# Altium project Main_Board.PrjPcb (part 25 of 44)

## Sheet RAM_Power.SchDoc: RAM_POWER
size A3; Organization: Altium Limited; Address1: L3, 12a Rodborough Rd; Address2: Frenchs Forest; Address3: NSW; Address4: Australia 2086
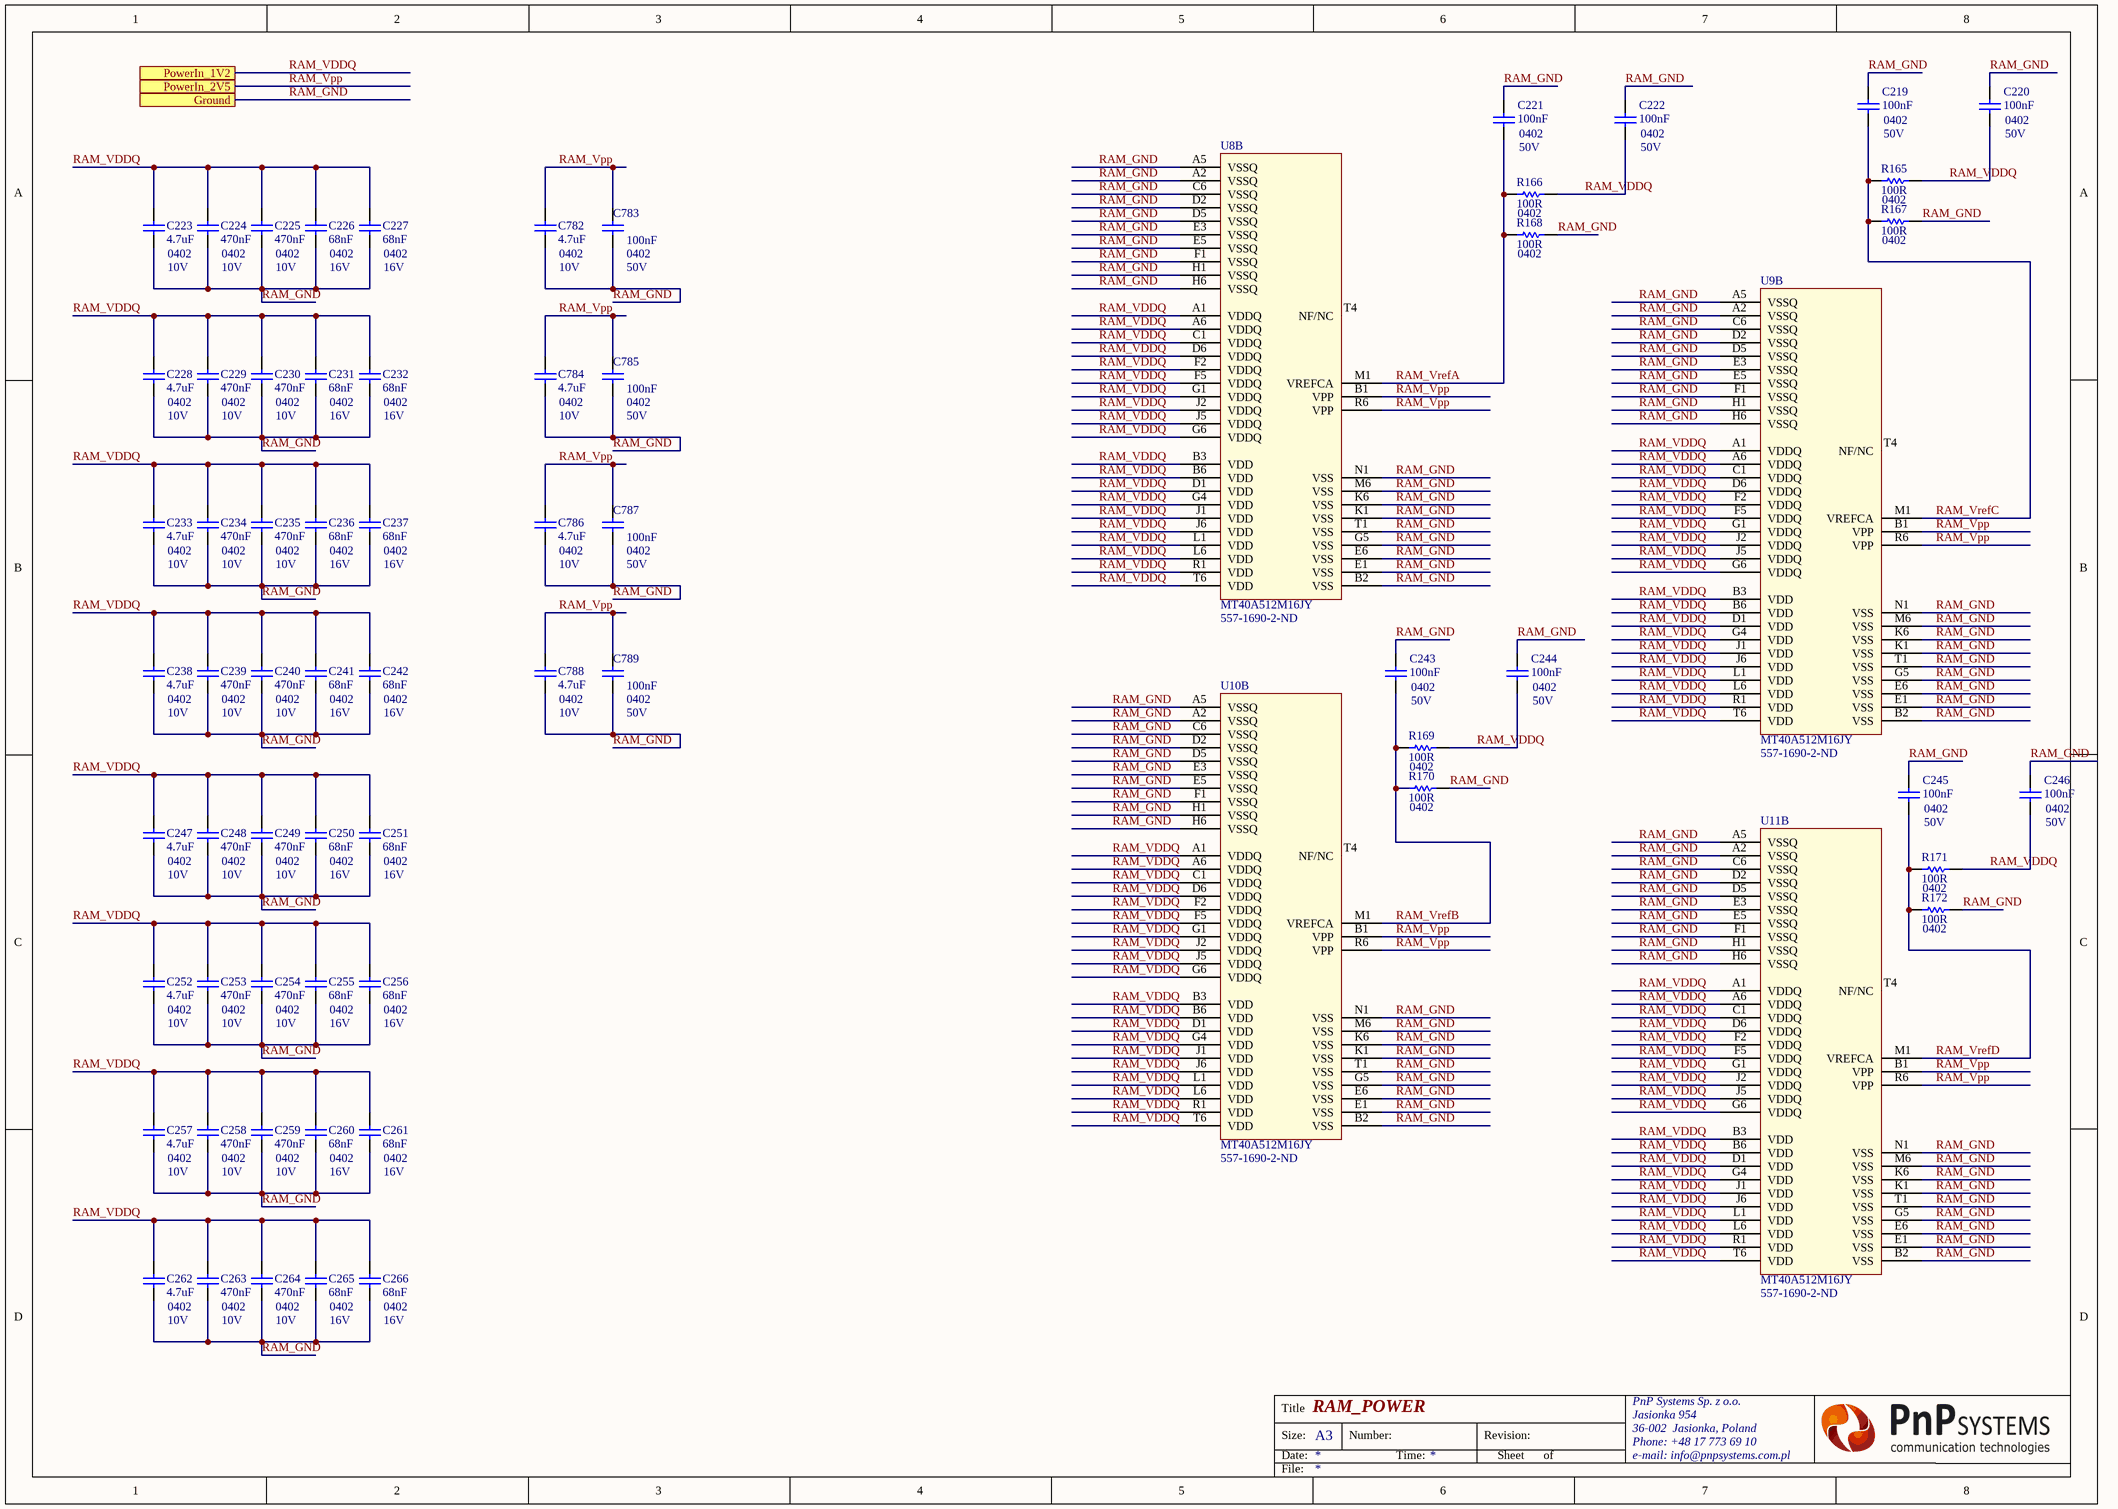
[diagram p34: RAM_Power.SchDoc]

### Parts
C219  100nF  Case Code (Imperial): 0402  Voltage: 50V  [CAP 0402/1005 KK]
C220  100nF  Case Code (Imperial): 0402  Voltage: 50V  [CAP 0402/1005 KK]
C221  100nF  Case Code (Imperial): 0402  Voltage: 50V  [CAP 0402/1005 KK]
C222  100nF  Case Code (Imperial): 0402  Voltage: 50V  [CAP 0402/1005 KK]
C223  4.7uF  Case/Package: 0402  Voltage Rating: 10V  [CAP 0402/1005 KK]
C224  470nF  Case/Package: 0402  Voltage Rating: 10V  [CAP 0402/1005 KK]
C225  470nF  Case/Package: 0402  Voltage Rating: 10V  [CAP 0402/1005 KK]
C226  68nF  Case/Package: 0402  Voltage Rating (DC): 16V  [CAP 0402/1005 KK]
C227  68nF  Case/Package: 0402  Voltage: 16V  [CAP 0402/1005 KK]
C228  4.7uF  Case/Package: 0402  Voltage Rating: 10V  [CAP 0402/1005 KK]
C229  470nF  Case/Package: 0402  Voltage Rating: 10V  [CAP 0402/1005 KK]
C230  470nF  Case/Package: 0402  Voltage Rating: 10V  [CAP 0402/1005 KK]
C231  68nF  Case/Package: 0402  Voltage Rating (DC): 16V  [CAP 0402/1005 KK]
C232  68nF  Case/Package: 0402  Voltage: 16V  [CAP 0402/1005 KK]
C233  4.7uF  Case/Package: 0402  Voltage Rating: 10V  [CAP 0402/1005 KK]
C234  470nF  Case/Package: 0402  Voltage Rating: 10V  [CAP 0402/1005 KK]
C235  470nF  Case/Package: 0402  Voltage Rating: 10V  [CAP 0402/1005 KK]
C236  68nF  Case/Package: 0402  Voltage Rating (DC): 16V  [CAP 0402/1005 KK]
C237  68nF  Case/Package: 0402  Voltage: 16V  [CAP 0402/1005 KK]
C238  4.7uF  Case/Package: 0402  Voltage Rating: 10V  [CAP 0402/1005 KK]
C239  470nF  Case/Package: 0402  Voltage Rating: 10V  [CAP 0402/1005 KK]
C240  470nF  Case/Package: 0402  Voltage Rating: 10V  [CAP 0402/1005 KK]
C241  68nF  Case/Package: 0402  Voltage Rating (DC): 16V  [CAP 0402/1005 KK]
C242  68nF  Case/Package: 0402  Voltage: 16V  [CAP 0402/1005 KK]
C243  100nF  Case Code (Imperial): 0402  Voltage: 50V  [CAP 0402/1005 KK]
C244  100nF  Case Code (Imperial): 0402  Voltage: 50V  [CAP 0402/1005 KK]
C245  100nF  Case Code (Imperial): 0402  Voltage: 50V  [CAP 0402/1005 KK]
C246  100nF  Case Code (Imperial): 0402  Voltage: 50V  [CAP 0402/1005 KK]
C247  4.7uF  Case/Package: 0402  Voltage Rating: 10V  [CAP 0402/1005 KK]
C248  470nF  Case/Package: 0402  Voltage Rating: 10V  [CAP 0402/1005 KK]
C249  470nF  Case/Package: 0402  Voltage Rating: 10V  [CAP 0402/1005 KK]
C250  68nF  Case/Package: 0402  Voltage Rating (DC): 16V  [CAP 0402/1005 KK]
C251  68nF  Case/Package: 0402  Voltage: 16V  [CAP 0402/1005 KK]
C252  4.7uF  Case/Package: 0402  Voltage Rating: 10V  [CAP 0402/1005 KK]
C253  470nF  Case/Package: 0402  Voltage Rating: 10V  [CAP 0402/1005 KK]
C254  470nF  Case/Package: 0402  Voltage Rating: 10V  [CAP 0402/1005 KK]
C255  68nF  Case/Package: 0402  Voltage Rating (DC): 16V  [CAP 0402/1005 KK]
C256  68nF  Case/Package: 0402  Voltage: 16V  [CAP 0402/1005 KK]
C257  4.7uF  Case/Package: 0402  Voltage Rating: 10V  [CAP 0402/1005 KK]
C258  470nF  Case/Package: 0402  Voltage Rating: 10V  [CAP 0402/1005 KK]
C259  470nF  Case/Package: 0402  Voltage Rating: 10V  [CAP 0402/1005 KK]
C260  68nF  Case/Package: 0402  Voltage Rating (DC): 16V  [CAP 0402/1005 KK]
C261  68nF  Case/Package: 0402  Voltage: 16V  [CAP 0402/1005 KK]
C262  4.7uF  Case/Package: 0402  Voltage Rating: 10V  [CAP 0402/1005 KK]
C263  470nF  Case/Package: 0402  Voltage Rating: 10V  [CAP 0402/1005 KK]
C264  470nF  Case/Package: 0402  Voltage Rating: 10V  [CAP 0402/1005 KK]
C265  68nF  Case/Package: 0402  Voltage Rating (DC): 16V  [CAP 0402/1005 KK]
C266  68nF  Case/Package: 0402  Voltage: 16V  [CAP 0402/1005 KK]
C782  4.7uF  Case/Package: 0402  Voltage Rating: 10V  [CAP 0402/1005 KK]
C783  100nF  Case Code (Imperial): 0402  Voltage: 50V  [CAP 0402/1005 KK]
C784  4.7uF  Case/Package: 0402  Voltage Rating: 10V  [CAP 0402/1005 KK]
C785  100nF  Case Code (Imperial): 0402  Voltage: 50V  [CAP 0402/1005 KK]
C786  4.7uF  Case/Package: 0402  Voltage Rating: 10V  [CAP 0402/1005 KK]
C787  100nF  Case Code (Imperial): 0402  Voltage: 50V  [CAP 0402/1005 KK]
C788  4.7uF  Case/Package: 0402  Voltage Rating: 10V  [CAP 0402/1005 KK]
C789  100nF  Case Code (Imperial): 0402  Voltage: 50V  [CAP 0402/1005 KK]
R165  100R  Case/Package: 0402  [RES 0402/1005 RF KK]
R166  100R  Case/Package: 0402  [RES 0402/1005 RF KK]
R167  100R  Case/Package: 0402  [RES 0402/1005 RF KK]
R168  100R  Case/Package: 0402  [RES 0402/1005 RF KK]
R169  100R  Case/Package: 0402  [RES 0402/1005 RF KK]
R170  100R  Case/Package: 0402  [RES 0402/1005 RF KK]
R171  100R  Case/Package: 0402  [RES 0402/1005 RF KK]
R172  100R  Case/Package: 0402  [RES 0402/1005 RF KK]
U8  MT40A512M16JY  Supplier Part Number 1: 557-1690-2-ND  [MT40A512M16JY]  (part B of 2)
U9  MT40A512M16JY  Supplier Part Number 1: 557-1690-2-ND  [MT40A512M16JY]  (part B of 2)
U10  MT40A512M16JY  Supplier Part Number 1: 557-1690-2-ND  [MT40A512M16JY]  (part B of 2)
U11  MT40A512M16JY  Supplier Part Number 1: 557-1690-2-ND  [MT40A512M16JY]  (part B of 2)

### Ports
Ground, PowerIn_1V2, PowerIn_2V5

### Nets
RAM_GND: C219.2 C220.2 C221.2 C222.2 C223.1 C224.1 C225.1 C226.1 C227.1 C228.1 C229.1 C230.1 C231.1 C232.1 C233.1 C234.1 C235.1 C236.1 C237.1 C238.1 C239.1 C240.1 C241.1 C242.1 C243.2 C244.2 C245.2 C246.2 C247.1 C248.1 C249.1 C250.1 C251.1 C252.1 C253.1 C254.1 C255.1 C256.1 C257.1 C258.1 C259.1 C260.1 C261.1 C262.1 C263.1 C264.1 C265.1 C266.1 C782.1 C783.1 C784.1 C785.1 C786.1 C787.1 C788.1 C789.1 R167.2 R168.2 R170.2 R172.2 U8.A2(VSSQ) U8.A5(VSSQ) U8.B2(VSS) U8.C6(VSSQ) U8.D2(VSSQ) U8.D5(VSSQ) U8.E1(VSS) U8.E3(VSSQ) U8.E5(VSSQ) U8.E6(VSS) U8.F1(VSSQ) U8.G5(VSS) U8.H1(VSSQ) U8.H6(VSSQ) U8.K1(VSS) U8.K6(VSS) U8.M6(VSS) U8.N1(VSS) U8.T1(VSS) U9.A2(VSSQ) U9.A5(VSSQ) U9.B2(VSS) U9.C6(VSSQ) U9.D2(VSSQ) U9.D5(VSSQ) U9.E1(VSS) U9.E3(VSSQ) U9.E5(VSSQ) U9.E6(VSS) U9.F1(VSSQ) U9.G5(VSS) U9.H1(VSSQ) U9.H6(VSSQ) U9.K1(VSS) U9.K6(VSS) U9.M6(VSS) U9.N1(VSS) U9.T1(VSS) U10.A2(VSSQ) U10.A5(VSSQ) U10.B2(VSS) U10.C6(VSSQ) U10.D2(VSSQ) U10.D5(VSSQ) U10.E1(VSS) U10.E3(VSSQ) U10.E5(VSSQ) U10.E6(VSS) U10.F1(VSSQ) U10.G5(VSS) U10.H1(VSSQ) U10.H6(VSSQ) U10.K1(VSS) U10.K6(VSS) U10.M6(VSS) U10.N1(VSS) U10.T1(VSS) U11.A2(VSSQ) U11.A5(VSSQ) U11.B2(VSS) U11.C6(VSSQ) U11.D2(VSSQ) U11.D5(VSSQ) U11.E1(VSS) U11.E3(VSSQ) U11.E5(VSSQ) U11.E6(VSS) U11.F1(VSSQ) U11.G5(VSS) U11.H1(VSSQ) U11.H6(VSSQ) U11.K1(VSS) U11.K6(VSS) U11.M6(VSS) U11.N1(VSS) U11.T1(VSS) ; port Ground  [project net B503_Ground]
RAM_VDDQ: C220.1 C222.1 C223.2 C224.2 C225.2 C226.2 C227.2 C228.2 C229.2 C230.2 C231.2 C232.2 C233.2 C234.2 C235.2 C236.2 C237.2 C238.2 C239.2 C240.2 C241.2 C242.2 C244.1 C246.1 C247.2 C248.2 C249.2 C250.2 C251.2 C252.2 C253.2 C254.2 C255.2 C256.2 C257.2 C258.2 C259.2 C260.2 C261.2 C262.2 C263.2 C264.2 C265.2 C266.2 R165.2 R166.2 R169.2 R171.2 U8.A1(VDDQ) U8.A6(VDDQ) U8.B3(VDD) U8.B6(VDD) U8.C1(VDDQ) U8.D1(VDD) U8.D6(VDDQ) U8.F2(VDDQ) U8.F5(VDDQ) U8.G1(VDDQ) U8.G4(VDD) U8.G6(VDDQ) U8.J1(VDD) U8.J2(VDDQ) U8.J5(VDDQ) U8.J6(VDD) U8.L1(VDD) U8.L6(VDD) U8.R1(VDD) U8.T6(VDD) U9.A1(VDDQ) U9.A6(VDDQ) U9.B3(VDD) U9.B6(VDD) U9.C1(VDDQ) U9.D1(VDD) U9.D6(VDDQ) U9.F2(VDDQ) U9.F5(VDDQ) U9.G1(VDDQ) U9.G4(VDD) U9.G6(VDDQ) U9.J1(VDD) U9.J2(VDDQ) U9.J5(VDDQ) U9.J6(VDD) U9.L1(VDD) U9.L6(VDD) U9.R1(VDD) U9.T6(VDD) U10.A1(VDDQ) U10.A6(VDDQ) U10.B3(VDD) U10.B6(VDD) U10.C1(VDDQ) U10.D1(VDD) U10.D6(VDDQ) U10.F2(VDDQ) U10.F5(VDDQ) U10.G1(VDDQ) U10.G4(VDD) U10.G6(VDDQ) U10.J1(VDD) U10.J2(VDDQ) U10.J5(VDDQ) U10.J6(VDD) U10.L1(VDD) U10.L6(VDD) U10.R1(VDD) U10.T6(VDD) U11.A1(VDDQ) U11.A6(VDDQ) U11.B3(VDD) U11.B6(VDD) U11.C1(VDDQ) U11.D1(VDD) U11.D6(VDDQ) U11.F2(VDDQ) U11.F5(VDDQ) U11.G1(VDDQ) U11.G4(VDD) U11.G6(VDDQ) U11.J1(VDD) U11.J2(VDDQ) U11.J5(VDDQ) U11.J6(VDD) U11.L1(VDD) U11.L6(VDD) U11.R1(VDD) U11.T6(VDD) ; port PowerIn_1V2  [project net RAM_Vcc1V2]
RAM_Vpp: C782.2 C783.2 C784.2 C785.2 C786.2 C787.2 C788.2 C789.2 U8.B1(VPP) U8.R6(VPP) U9.B1(VPP) U9.R6(VPP) U10.B1(VPP) U10.R6(VPP) U11.B1(VPP) U11.R6(VPP) ; port PowerIn_2V5  [project net 2V5@1.5A]
RAM_VrefA: C221.1 R166.1 R168.1 U8.M1(VREFCA)
RAM_VrefB: C243.1 R169.1 R170.1 U10.M1(VREFCA)
RAM_VrefC: C219.1 R165.1 R167.1 U9.M1(VREFCA)
RAM_VrefD: C245.1 R171.1 R172.1 U11.M1(VREFCA)

Not connected (* = marked no-connect by the designer): U8 T4(NF/NC); U9 T4(NF/NC); U10 T4(NF/NC); U11 T4(NF/NC)

### Notes on the sheet
- Title
- Size:
- Date:
- A3
- Number:
- Time:
- Revision:
- Sheet
- of
- File:

### Library data of the parts
C219-C222 C243-C246 C783 C785 C787 C789 = Capacitor: CAP CER 0.1UF 50V X5R 0402; Manufacturer: Murata; Manufacturer Part Number: GRM155R61H104KE14D; Dielectric Material: Ceramic; Dissipation Factor: 0.025%; Tolerance: 10%; Supplier 1: Digi-Key; Supplier Part Number 1: 490-10697-1-ND; RoHS: Yes; Category: Ceramic Capacitors; Stock 1: 435607; Pricing 1: 1=0,10000, 10=0,04600, 100=0,02050, 500=0,01464, 1000=0,01150, 2500=0,01045, 5000=0,00961 (USD); Mount: Surface Mount; Case/Package: 0402; Weight: 0.000212oz; Case Code (Metric): 1005; Min Operating Temperature: -55°C; Max Operating Temperature: 85°C; Capacitance: 100nF; Packaging: Tape and Reel; Voltage Rating: 50V; Dielectric: X5R; Termination: SMD/SMT; Composition: Ceramic; Voltage Rating (DC): 50V; Package Quantity: 10000; Length: 1mm; Height: 0.5mm; Width: 0.02inch; Thickness: 0.022inch; Depth: 0.5mm; REACH SVHC: No SVHC; Lead Free: Lead Free; ComponentLink1URL: http://www.farnell.com/datasheets/2079150.pdf?src-supplier=Farnell; ComponentLink1Description: http://www.farnell.com/datasheets/2079150.pdf?src-supplier=Farnell; ComponentLink2URL: http://www.mouser.com/ds/2/281/c02e-2905.pdf?src-supplier=Mouser; ComponentLink2Description: http://www.mouser.com/ds/2/281/c02e-2905.pdf?src-supplier=Mouser; ComponentLink3URL: http://www.farnell.com/datasheets/2079150.pdf?src-supplier=Element14; ComponentLink3Description: http://www.farnell.com/datasheets/2079150.pdf?src-supplier=Element14; ComponentLink4URL: http://search.murata.co.jp/Ceramy/image/img/A01X/G101/ENG/GRM155R61H104KE14-01.pdf?src-supplier=Digi-Key; ComponentLink4Description: http://search.murata.co.jp/Ceramy/image/img/A01X/G101/ENG/GRM155R61H104KE14-01.pdf?src-supplier=Digi-Key
C223 C228 C233 C238 C247 C252 C257 C262 C782 C784 C786 C788 = Capacitor: 0402 10 V 4.7 uF ±20% Tolerance X5R Multilayer Ceramic Chip Capacitor; Manufacturer: Murata; Manufacturer Part Number: GRM155R61A475MEAAD; Supplier 1: Digi-Key; Supplier Part Number 1: 490-14306-1-ND; Category: Ceramic Capacitors; Stock 1: 980102; Pricing 1: 1=0,23000, 10=0,15400, 100=0,07780, 500=0,05322, 1000=0,04708, 2500=0,04504, 5000=0,04094 (USD); Mount: Surface Mount; Case Code (Imperial): 0402; Case Code (Metric): 1005; Min Operating Temperature: -55°C; Max Operating Temperature: 85°C; Packaging: Tape and Reel; Capacitance: 4.7uF; Tolerance: 20%; ComponentLink1URL: http://www.farnell.com/datasheets/2189109.pdf?src-supplier=Farnell; ComponentLink1Description: http://www.farnell.com/datasheets/2189109.pdf?src-supplier=Farnell; ComponentLink2URL: https://search.murata.co.jp/Ceramy/image/img/A01X/G101/ENG/GRM155R61A475MEAA-01.pdf?src-supplier=Digi-Key; ComponentLink2Description: https://search.murata.co.jp/Ceramy/image/img/A01X/G101/ENG/GRM155R61A475MEAA-01.pdf?src-supplier=Digi-Key; ComponentLink3URL: http://datasheet.octopart.com/GRM155R61A475MEAAD-Murata-datasheet-68589269.pdf?src-supplier=Newark; ComponentLink3Description: http://datasheet.octopart.com/GRM155R61A475MEAAD-Murata-datasheet-68589269.pdf?src-supplier=Newark; ComponentLink4URL: http://datasheet.octopart.com/GRM155R61A475MEAAD-Murata-datasheet-8819587.pdf; ComponentLink4Description: http://datasheet.octopart.com/GRM155R61A475MEAAD-Murata-datasheet-8819587.pdf; ComponentLink5URL: http://datasheet.octopart.com/GRM155R61A475MEAAD-Murata-datasheet-10025737.pdf; ComponentLink5Description: http://datasheet.octopart.com/GRM155R61A475MEAAD-Murata-datasheet-10025737.pdf; ComponentLink6URL: http://datasheet.octopart.com/GRM155R61A475MEAAD-Murata-datasheet-11978611.pdf; ComponentLink6Description: http://datasheet.octopart.com/GRM155R61A475MEAAD-Murata-datasheet-11978611.pdf; ComponentLink7URL: http://datasheet.octopart.com/GRM155R61A475MEAAD-Murata-datasheet-12510076.pdf; ComponentLink7Description: http://datasheet.octopart.com/GRM155R61A475MEAAD-Murata-datasheet-12510076.pdf; ComponentLink8URL: http://datasheet.octopart.com/GRM155R61A475MEAAD-Murata-datasheet-12515295.pdf; ComponentLink8Description: http://datasheet.octopart.com/GRM155R61A475MEAAD-Murata-datasheet-12515295.pdf
C224 C225 C229 C230 C234 C235 C239 C240 C248 C249 C253 C254 C258 C259 C263 C264 = Capacitor: Cap Ceramic 0.47uF 10V X5R 10% SMD 0402 85C Paper T/R; Manufacturer: Samsung; Manufacturer Part Number: CL05A474KP5NNNC; Supplier 1: Digi-Key; Supplier Part Number 1: 1276-1173-1-ND; RoHS: Yes; Category: Ceramic Capacitors; Stock 1: 809805; Pricing 1: 1=0,10000, 10=0,07000, 100=0,03140, 500=0,02240, 1000=0,01761, 2500=0,01600, 5000=0,01472 (USD); Mount: Surface Mount; Case Code (Metric): 1005; Case Code (Imperial): 0402; Min Operating Temperature: -55°C; Max Operating Temperature: 85°C; Tolerance: 10%; Capacitance: 470nF; Dielectric: X5R; Packaging: Tape and Reel; Voltage Rating (DC): 10V; Length: 1mm; Height: 0.5mm; Width: 0.02inch; Thickness: 0.022inch; Depth: 0.5mm; Radiation Hardening: No; Lead Free: Lead Free; ComponentLink1URL: https://datasheet.ciiva.com/25710/cl05a474kp5nnnc-25710324.pdf?src-supplier=Digi-Key; ComponentLink1Description: https://datasheet.ciiva.com/25710/cl05a474kp5nnnc-25710324.pdf?src-supplier=Digi-Key; ComponentLink2URL: https://datasheet.ciiva.com/26838/getdatasheetpartid-355286-26838191.pdf?src-supplier=Verical; ComponentLink2Description: https://datasheet.ciiva.com/26838/getdatasheetpartid-355286-26838191.pdf?src-supplier=Verical; ComponentLink3URL: https://datasheet.ciiva.com/16437/cl05b104kq5nnnc-16437351.pdf?src-supplier=Future+Electronics; ComponentLink3Description: https://datasheet.ciiva.com/16437/cl05b104kq5nnnc-16437351.pdf?src-supplier=Future+Electronics
C226 C227 C231 C232 C236 C237 C241 C242 C250 C251 C255 C256 C260 C261 C265 C266 = Capacitor: KEMET - C0402C683K4RACTU - CAP, 0.068µF, 16V, 10%, X7R, 0402; Dielectric Material: Ceramic; Dissipation Factor: 3.5%; Supplier 1: Digi-Key; Supplier Part Number 1: 399-4904-1-ND; Manufacturer: KEMET; Manufacturer Part Number: C0402C683K4RACTU; RoHS: Yes; Category: Ceramic Capacitors; Stock 1: 40544; Pricing 1: 1=0,44000, 10=0,30900, 100=0,18520, 500=0,13890, 1000=0,11729, 2500=0,11112, 5000=0,10494 (USD); Mount: Surface Mount,PCB; Number of Pins: 2; Case Code (Metric): 1005; Case Code (Imperial): 0402; Min Operating Temperature: -55°C; Max Operating Temperature: 125°C; Package Quantity: 1; Capacitance: 68nF; Voltage Rating: 16V; Tolerance: 10%; Packaging: Tape and Reel; Dielectric: X7R; Termination: SMD/SMT; Length: 1mm; Height: 0.5mm; Width: 0.02inch; Thickness: 0.022inch; Lead Pitch: 0.3mm; Depth: 0.5mm; Radiation Hardening: No; REACH SVHC: No SVHC; ComponentLink1URL: https://datasheet.ciiva.com/26923/getdatasheetpartid-385429-26923888.pdf?src-supplier=Verical; ComponentLink1Description: https://datasheet.ciiva.com/26923/getdatasheetpartid-385429-26923888.pdf?src-supplier=Verical; ComponentLink2URL: https://datasheet.ciiva.com/7747/1691965-7747573.pdf?src-supplier=Element14; ComponentLink2Description: https://datasheet.ciiva.com/7747/1691965-7747573.pdf?src-supplier=Element14; ComponentLink3URL: https://datasheet.ciiva.com/7747/1691965-7747574.pdf?src-supplier=Element14; ComponentLink3Description: https://datasheet.ciiva.com/7747/1691965-7747574.pdf?src-supplier=Element14; ComponentLink4URL: https://datasheet.ciiva.com/7378/40889-7378698.pdf?src-supplier=Newark; ComponentLink4Description: https://datasheet.ciiva.com/7378/40889-7378698.pdf?src-supplier=Newark
  C226 C231 C236 C241 C250 C255 C260 C265: Voltage: 16V
  C227 C232 C237 C242 C251 C256 C261 C266: Voltage Rating (DC): 16V
R165-R172 = Resistor: RES SMD 100 OHM 1% 1/16W 0402; Manufacturer: Yageo; Manufacturer Part Number: RC0402FR-07100RL; Power Rating: 62.5mW; Voltage Rating: 50V; Temperature Coefficient: 100ppm/°C; Supplier 1: Digi-Key; Supplier Part Number 1: 311-100LRDKR-ND; RoHS: Yes; Category: Chip SMD Resistors; Stock 1: 42078262; Pricing 1: 1=0,10000, 10=0,01600, 100=0,00640, 1000=0,00289, 2500=0,00251, 5000=0,00207 (USD); Number of Pins: 2; Case Code (Imperial): 0402; Case Code (Metric): 1005; Min Operating Temperature: -55°C; Max Operating Temperature: 155°C; Tolerance: 1%; Resistance: 100R; Packaging: Tape and Reel; Termination: SMD/SMT; Composition: Thick Film; Military Standard: Not; Voltage Rating (DC): 50V; Length: 1mm; Height: 0.32mm; Depth: 0.5mm; Width: 0.5mm; REACH SVHC: No SVHC; Lead Free: Lead Free; ComponentLink1URL: https://datasheet.ciiva.com/7849/1784430-7849810.pdf?src-supplier=Element14; ComponentLink1Description: https://datasheet.ciiva.com/7849/1784430-7849810.pdf?src-supplier=Element14; ComponentLink2URL: https://datasheet.ciiva.com/11808/0900766b80c66297-11808765.pdf?src-supplier=RSComponents; ComponentLink2Description: https://datasheet.ciiva.com/11808/0900766b80c66297-11808765.pdf?src-supplier=RSComponents; ComponentLink3URL: https://datasheet.ciiva.com/12667/pyu-rc0402-51-rohs-l-6-r-12667957.pdf?src-supplier=Mouser; ComponentLink3Description: https://datasheet.ciiva.com/12667/pyu-rc0402-51-rohs-l-6-r-12667957.pdf?src-supplier=Mouser; ComponentLink4URL: https://datasheet.ciiva.com/16740/pyu-rc0402-51-rohs-l-6-r-16740566.pdf?src-supplier=Future+Electronics; ComponentLink4Description: https://datasheet.ciiva.com/16740/pyu-rc0402-51-rohs-l-6-r-16740566.pdf?src-supplier=Future+Electronics; ComponentLink5URL: https://datasheet.ciiva.com/15189/getdatasheetpartid-329466-15189335.pdf?src-supplier=Verical; ComponentLink5Description: https://datasheet.ciiva.com/15189/getdatasheetpartid-329466-15189335.pdf?src-supplier=Verical; ComponentLink6URL: https://datasheet.ciiva.com/28367/1018594-28367226.pdf?src-supplier=Element14; ComponentLink6Description: https://datasheet.ciiva.com/28367/1018594-28367226.pdf?src-supplier=Element14; ComponentLink7URL: https://datasheet.ciiva.com/22747/1018594-22747511.pdf?src-supplier=Element14; ComponentLink7Description: https://datasheet.ciiva.com/22747/1018594-22747511.pdf?src-supplier=Element14
U8-U11 = MT40A512M16JY: RAM 8GB; Manufacturer: Micron Technology; Manufacturer Part Number: MT40A512M16JY-083EIT:BTR; Memory Type: RAM,SDRAM; Frequency: 1.2GHz; Interface: Parallel; Supplier 1: Digi-Key; Stock 1: 0; Pricing 1: 2000 = 12,80254 (USD); RoHS: Yes; Min Operating Temperature: -40°C; Max Operating Temperature: 95°C; ComponentLink1URL: https://www.micron.com/~/media/documents/products/data-sheet/dram/ddr4/8gb_ddr4_sdram.pdf?src-supplier=Digi-Key; ComponentLink1Description: https://www.micron.com/~/media/documents/products/data-sheet/dram/ddr4/8gb_ddr4_sdram.pdf?src-supplier=Digi-Key